# EAGLE design blinky (EAGLE 9.6.2)
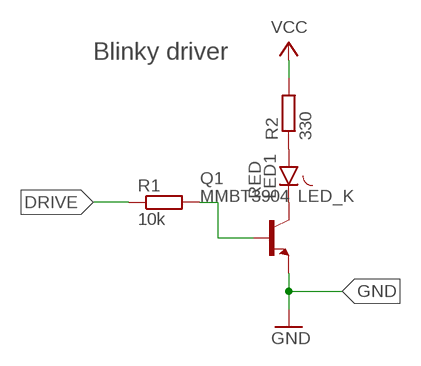
[diagram p0: schematic, sheet 1]

## Parts
LED1  RED  LED3MM  [LED3MM]
Q1  MMBT3904  [SOT23]
R1  10k  R0603  [R0603]
R2  330  R0603  [R0603]

## Nets
BASE: Q1.1(B) R1.2
DRIVE: R1.1
GND: Q1.2(E)
LED_K: LED1.K(C) Q1.3(C)
N$1: LED1.A R2.1
VCC: R2.2

## Notes on the sheet
- Blinky driver

## Library data of the parts
LED1 = demo:LED
Q1 = demo:MMBT3904: NPN switching transistor; MANUFACTURER: onsemi; MPN: MMBT3904LT1G
R1 = demo:R: Resistor 0603; MANUFACTURER: Yageo; MPN: RC0603FR-0710KL
R2 = demo:R: Resistor 0603

## Board
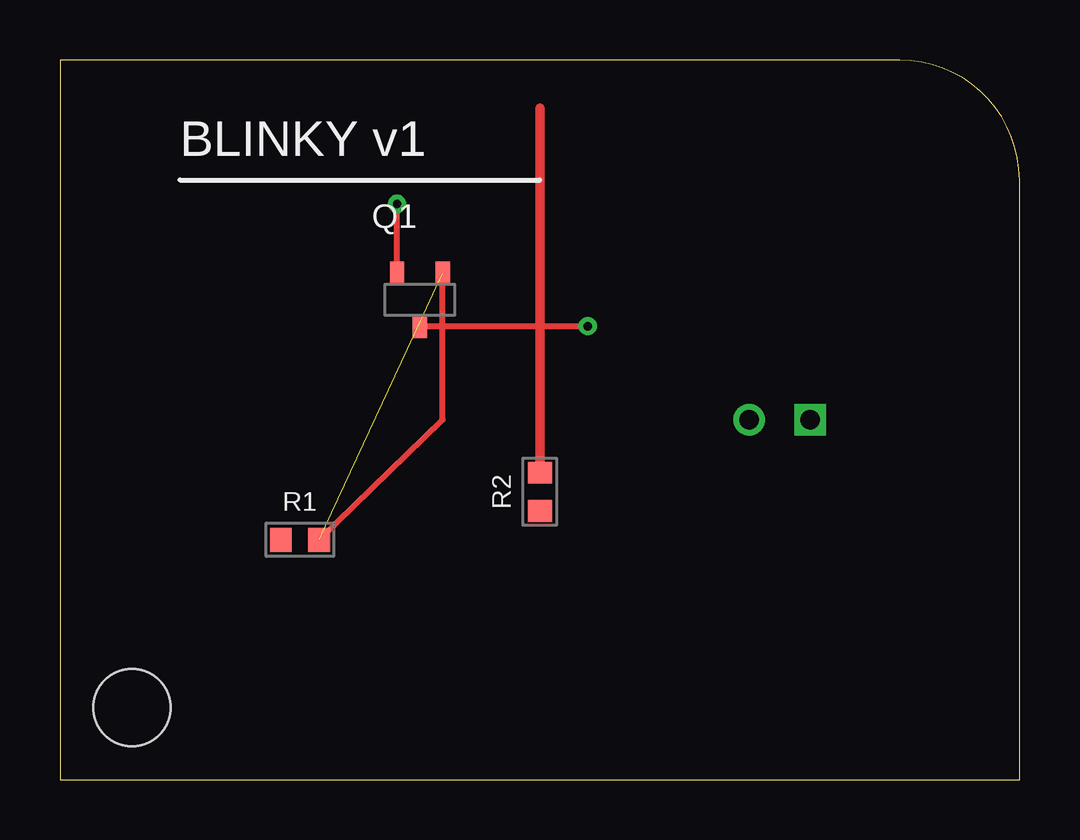
[diagram p1: board, top side]
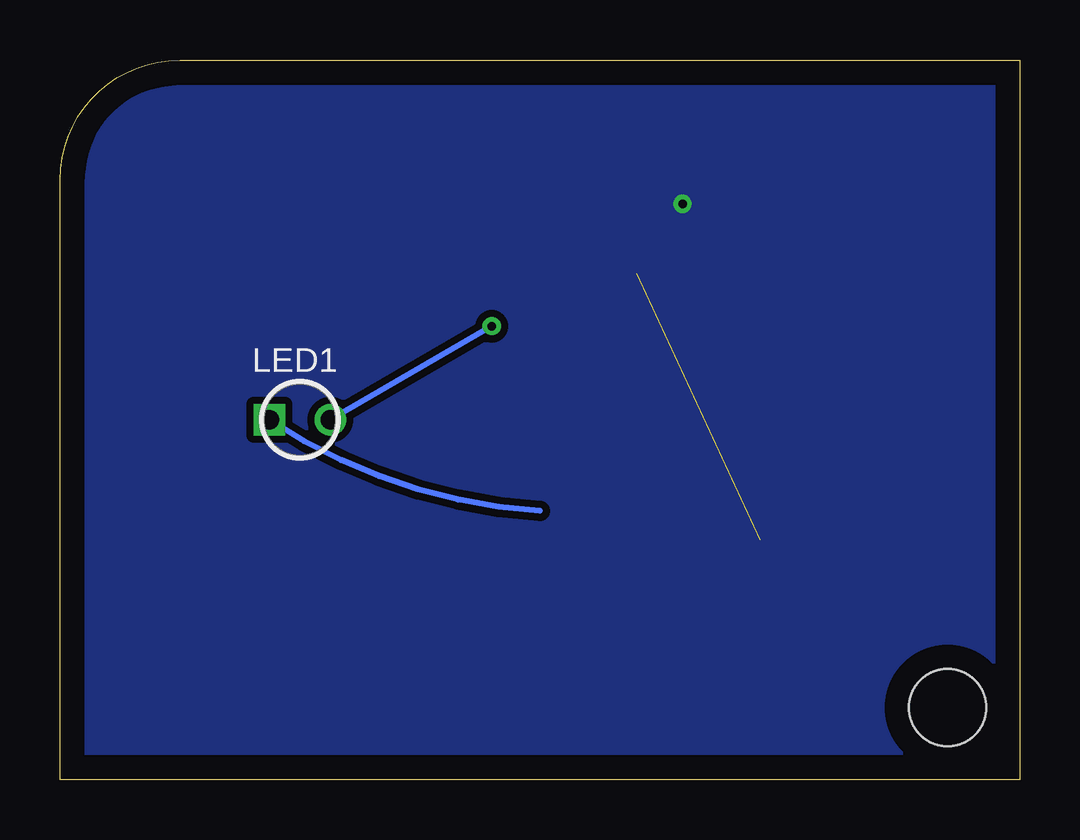
[diagram p2: board, bottom side, seen from below]

Size 40 x 30 mm. Coordinates in mm from the lower left corner, seen from the top.
Outline: 0,0 40,0 40,25 arc90 35,30 0,30 0,0
Copper layers (1*16): Top 0.035mm / dielectric 1.5mm / Bottom
Design rules "default": minimum pad ring 10mil, minimum via ring 8mil
Holes 3.2 mm at 3,3

### Footprints (pad centres in the part's own frame; a part is rotated, then mirrored left to right if it is on the bottom)
LED3MM = drill 0.8 square: A -1.27,0 | drill 0.8: K 1.27,0
SOT23 = smd 0.6 x 1: 1 -0.95,-1.1; 2 0.95,-1.1; 3 0,1.1
R0603 = smd 0.9 x 1: 1 -0.8,0; 2 0.8,0

### Placement (x,y rotation side)
LED1  30,15 0 bottom
Q1  15,20 180 top
R1  10,10 0 top
R2  20,12 90 top

### Tracks (layer width: path | path; a pad name or v marks a point on that pad's centre or on a via)
BASE  (1 unrouted)
  Top 0.25: R1.2 15.95,15 Q1.1
GND  (via drill 0.35 pad 0.7)
  Top 0.25: Q1.2 v14.05,24
  pour Bottom (isolate 0.3): 1,1 39,1 39,29 1,29
LED_K  (via drill 0.35)
  Top 0.25: Q1.3 v22,18.9
  Bottom 0.25: v22,18.9 LED1.K
N$1
  Bottom 0.25: R2.1 arc30 LED1.A
VCC
  Top 0.4: R2.2 20,28

### Text on the board
tPlace: BLINKY v1